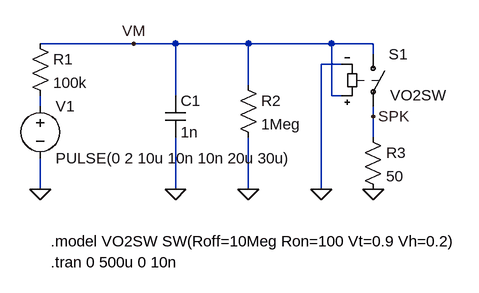
[diagram p0: schematic lif-vo2.asc]
lif-vo2.asc, the LTspice schematic file:
Version 4
SHEET 1 880 680
WIRE 224 128 80 128
WIRE 288 128 224 128
WIRE 400 128 288 128
WIRE 528 128 400 128
WIRE 592 128 528 128
WIRE 592 144 592 128
WIRE 544 160 512 160
WIRE 400 192 400 128
WIRE 288 208 288 128
WIRE 528 208 528 128
WIRE 544 208 528 208
WIRE 80 224 80 208
WIRE 592 240 592 224
WIRE 592 272 592 240
WIRE 80 352 80 304
WIRE 288 352 288 272
WIRE 400 352 400 272
WIRE 512 352 512 160
FLAG 80 352 0
FLAG 288 352 0
FLAG 400 352 0
FLAG 592 352 0
FLAG 224 128 VM
FLAG 592 240 SPK
FLAG 512 352 0
SYMBOL voltage 80 208 R0
WINDOW 123 0 0 Left 0
WINDOW 39 0 0 Left 0
SYMATTR InstName V1
SYMATTR Value PULSE(0 2 10u 10n 10n 20u 30u)
SYMBOL res 64 112 R0
SYMATTR InstName R1
SYMATTR Value 100k
SYMBOL cap 272 208 R0
SYMATTR InstName C1
SYMATTR Value 1n
SYMBOL res 384 176 R0
SYMATTR InstName R2
SYMATTR Value 1Meg
SYMBOL sw 592 128 R0
WINDOW 3 26 79 Left 2
SYMATTR InstName S1
SYMATTR Value VO2SW
SYMBOL res 576 256 R0
SYMATTR InstName R3
SYMATTR Value 50
TEXT 96 432 Left 2 !.model VO2SW SW(Roff=10Meg Ron=100 Vt=0.9 Vh=0.2)
TEXT 96 464 Left 2 !.tran 0 500u 0 10n

The netlist it stands for:
* lif-vo2.asc
V1 N001 0 PULSE(0 2 10u 10n 10n 20u 30u)
R1 VM N001 100k
C1 VM 0 1n
R2 VM 0 1Meg
S1 VM SPK VM 0 VO2SW
R3 SPK 0 50
.model VO2SW SW(Roff=10Meg Ron=100 Vt=0.9 Vh=0.2)
.tran 0 500u 0 10n
.backanno
.end